# Altium schematic sheet Top-Sheet.SchDoc
size A4; DocumentNumber: 1; SheetNumber: 1; SheetTotal: 8
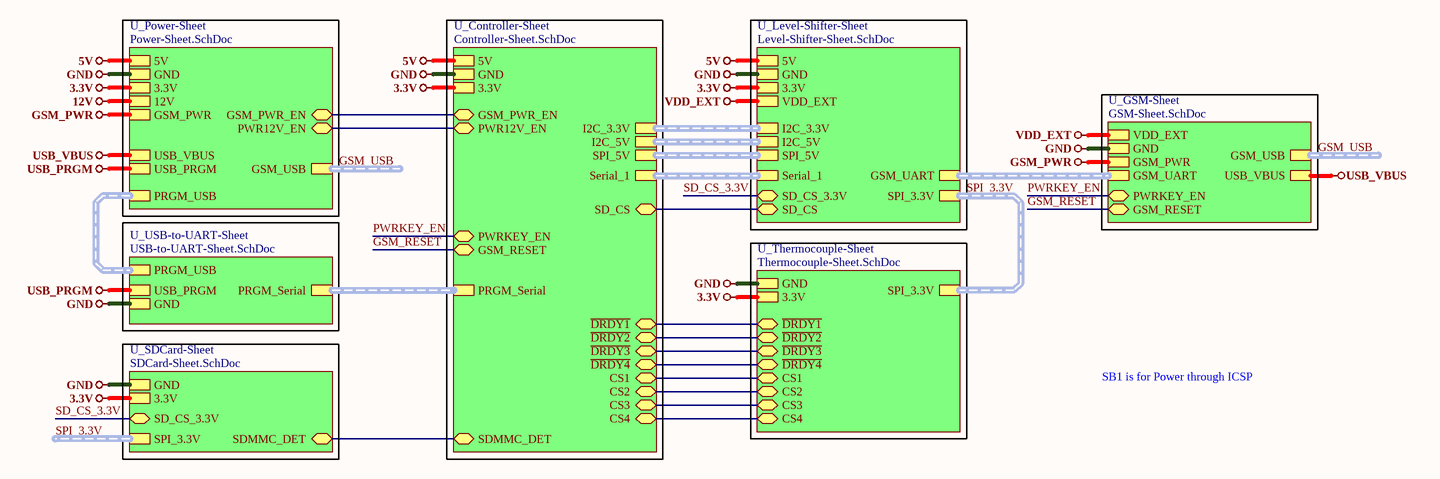
[diagram p0: Top-Sheet.SchDoc]

## Sub-sheets
U_Controller-Sheet = Controller-Sheet.SchDoc: I2C_3.3V (harness I2C_3.3V), I2C_5V (harness I2C_5V), SPI_5V (harness SPI_5V), PRGM_Serial (harness PRGM_Serial), Serial_1 (harness Serial_1), ~{DRDY1} (bidir), ~{DRDY2} (bidir), ~{DRDY3} (bidir), ~{DRDY4} (bidir), CS1 (bidir), CS2 (bidir), CS3 (bidir), CS4 (bidir), PWRKEY_EN (bidir), GSM_RESET (bidir), SDMMC_DET (bidir), SD_CS (bidir), GSM_PWR_EN (bidir), PWR12V_EN (bidir), 5V, GND, 3.3V
U_GSM-Sheet = GSM-Sheet.SchDoc: GSM_UART (harness GSM_UART), GND, GSM_PWR, VDD_EXT, GSM_USB (harness GSM_USB), PWRKEY_EN (bidir), GSM_RESET (bidir), USB_VBUS
U_Level-Shifter-Sheet = Level-Shifter-Sheet.SchDoc: SPI_3.3V (harness SPI_3.3V), 5V, GND, 3.3V, VDD_EXT, I2C_3.3V (harness I2C_3.3V), I2C_5V (harness I2C_5V), SPI_5V (harness SPI_5V), Serial_1 (harness Serial_1), GSM_UART (harness GSM_UART), SD_CS_3.3V (bidir), SD_CS (bidir)
U_Power-Sheet = Power-Sheet.SchDoc: 5V, GND, 3.3V, 12V, GSM_USB (harness GSM_USB), PRGM_USB (harness PRGM_USB), GSM_PWR_EN (bidir), PWR12V_EN (bidir), GSM_PWR, USB_PRGM, USB_VBUS
U_SDCard-Sheet = SDCard-Sheet.SchDoc: SPI_3.3V (harness SPI_3.3V), GND, 3.3V, SD_CS_3.3V (bidir), SDMMC_DET (bidir)
U_Thermocouple-Sheet = Thermocouple-Sheet.SchDoc: GND, 3.3V, SPI_3.3V (harness Harness), ~{DRDY1} (bidir), ~{DRDY2} (bidir), ~{DRDY3} (bidir), ~{DRDY4} (bidir), CS1 (bidir), CS2 (bidir), CS3 (bidir), CS4 (bidir)
U_USB-to-UART-Sheet = USB-to-UART-Sheet.SchDoc: GND, USB_PRGM, PRGM_USB (harness PRGM_USB), PRGM_Serial (harness PRGM_Serial)

## Nets
3.3V: sheet U_Power-Sheet/3.3V, sheet U_Thermocouple-Sheet/3.3V, sheet U_Level-Shifter-Sheet/3.3V, sheet U_SDCard-Sheet/3.3V, sheet U_Controller-Sheet/3.3V
5V: sheet U_Power-Sheet/5V, sheet U_Level-Shifter-Sheet/5V, sheet U_Controller-Sheet/5V
12V: sheet U_Power-Sheet/12V
GND: sheet U_Power-Sheet/GND, sheet U_Thermocouple-Sheet/GND, sheet U_Level-Shifter-Sheet/GND, sheet U_GSM-Sheet/GND, sheet U_USB-to-UART-Sheet/GND, sheet U_SDCard-Sheet/GND, sheet U_Controller-Sheet/GND
GSM_PWR: sheet U_Power-Sheet/GSM_PWR, sheet U_GSM-Sheet/GSM_PWR
USB_PRGM: sheet U_Power-Sheet/USB_PRGM, sheet U_USB-to-UART-Sheet/USB_PRGM
USB_VBUS: sheet U_Power-Sheet/USB_VBUS, sheet U_GSM-Sheet/USB_VBUS
VDD_EXT: sheet U_Level-Shifter-Sheet/VDD_EXT, sheet U_GSM-Sheet/VDD_EXT
GSM_RESET: sheet U_GSM-Sheet/GSM_RESET, sheet U_Controller-Sheet/GSM_RESET
PWRKEY_EN: sheet U_GSM-Sheet/PWRKEY_EN, sheet U_Controller-Sheet/PWRKEY_EN
SD_CS_3.3V: sheet U_Level-Shifter-Sheet/SD_CS_3.3V, sheet U_SDCard-Sheet/SD_CS_3.3V
(unnamed): sheet U_Power-Sheet/GSM_PWR_EN, sheet U_Controller-Sheet/GSM_PWR_EN
(unnamed): sheet U_Power-Sheet/PWR12V_EN, sheet U_Controller-Sheet/PWR12V_EN
(unnamed): sheet U_Thermocouple-Sheet/~{DRDY1}, sheet U_Controller-Sheet/~{DRDY1}
(unnamed): sheet U_Thermocouple-Sheet/~{DRDY2}, sheet U_Controller-Sheet/~{DRDY2}
(unnamed): sheet U_Thermocouple-Sheet/~{DRDY3}, sheet U_Controller-Sheet/~{DRDY3}
(unnamed): sheet U_Thermocouple-Sheet/~{DRDY4}, sheet U_Controller-Sheet/~{DRDY4}
(unnamed): sheet U_Thermocouple-Sheet/CS1, sheet U_Controller-Sheet/CS1
(unnamed): sheet U_Thermocouple-Sheet/CS2, sheet U_Controller-Sheet/CS2
(unnamed): sheet U_Thermocouple-Sheet/CS3, sheet U_Controller-Sheet/CS3
(unnamed): sheet U_Thermocouple-Sheet/CS4, sheet U_Controller-Sheet/CS4
(unnamed): sheet U_Level-Shifter-Sheet/SD_CS, sheet U_Controller-Sheet/SD_CS
(unnamed): sheet U_SDCard-Sheet/SDMMC_DET, sheet U_Controller-Sheet/SDMMC_DET

## Buses and harness runs
harness GSM_USB = sheet U_GSM-Sheet/GSM_USB
harness GSM_USB = sheet U_Power-Sheet/GSM_USB
harness sheet U_Controller-Sheet/I2C_3.3V = sheet U_Level-Shifter-Sheet/I2C_3.3V
harness sheet U_Controller-Sheet/I2C_5V = sheet U_Level-Shifter-Sheet/I2C_5V
harness sheet U_Controller-Sheet/PRGM_Serial = sheet U_USB-to-UART-Sheet/PRGM_Serial
harness sheet U_Controller-Sheet/Serial_1 = sheet U_Level-Shifter-Sheet/Serial_1
harness sheet U_Controller-Sheet/SPI_5V = sheet U_Level-Shifter-Sheet/SPI_5V
harness sheet U_GSM-Sheet/GSM_UART = sheet U_Level-Shifter-Sheet/GSM_UART
harness sheet U_Power-Sheet/PRGM_USB = sheet U_USB-to-UART-Sheet/PRGM_USB
harness SPI_3.3V = sheet U_Level-Shifter-Sheet/SPI_3.3V = sheet U_Thermocouple-Sheet/SPI_3.3V
harness SPI_3.3V = sheet U_SDCard-Sheet/SPI_3.3V

## Notes on the sheet
- SB1 is for Power through ICSP
- File:
- Title:
- Date:
- Page
- Num:
- Total:
- Drawn By: Huzaifa Ali